# Altium schematic sheet 60_User_Interface.SchDoc: Interfaz de usuario
size A4; DrawnBy: Mateo Cárdenas; Revision: Rev A; SheetNumber: 7; SheetTotal: 7
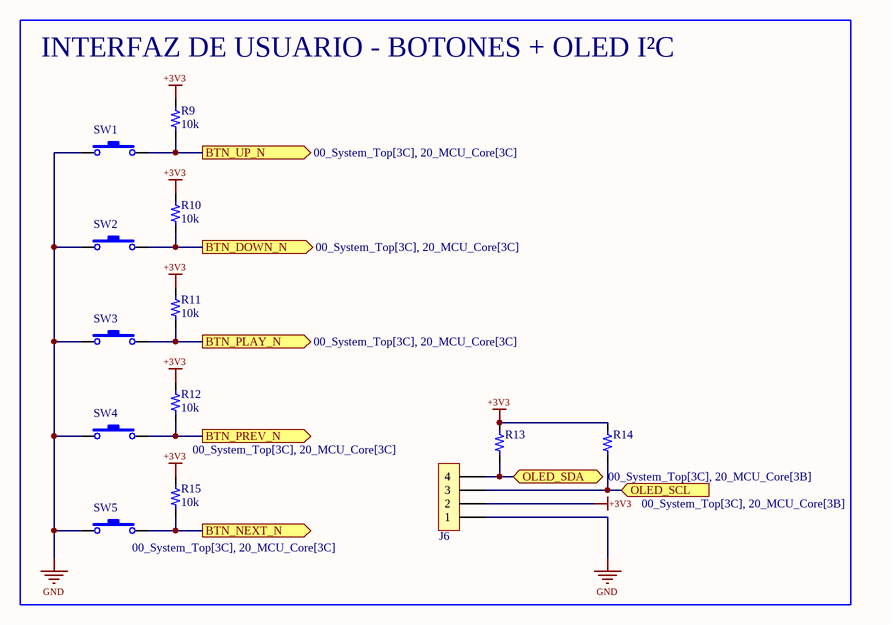
[diagram p0: 60_User_Interface.SchDoc]

## Parts
J6  4x1  [H_4x1_TH_2.54mm]  (value not drawn)  (no BOM)
R9  value 10k  [0603_res]  (hidden comment: 10k 1/10W)
R10  value 10k  [0603_res]  (hidden comment: 10k 1/10W)
R11  value 10k  [0603_res]  (hidden comment: 10k 1/10W)
R12  value 10k  [0603_res]  (hidden comment: 10k 1/10W)
R13  4k7 1/10W  [0603_res]  (value not drawn)
R14  4k7 1/10W  [0603_res]  (value not drawn)
R15  value 10k  [0603_res]  (hidden comment: 10k 1/10W)
SW1  Sw  [Sw_PUSH_4.5x4.5x5mm]  (value not drawn)
SW2  Sw  [Sw_PUSH_4.5x4.5x5mm]  (value not drawn)
SW3  Sw  [Sw_PUSH_4.5x4.5x5mm]  (value not drawn)
SW4  Sw  [Sw_PUSH_4.5x4.5x5mm]  (value not drawn)
SW5  Sw  [Sw_PUSH_4.5x4.5x5mm]  (value not drawn)

## Blocks framed on the sheet
INTERFAZ DE USUARIO - BOTONES + OLED I²C: J6 R9-R15 SW1-SW5

## Ports
BTN_DOWN_N (out, see 00_System_Top[3C], 20_MCU_Core[3C]), BTN_NEXT_N (out, see 00_System_Top[3C], 20_MCU_Core[3C]), BTN_PLAY_N (out, see 00_System_Top[3C], 20_MCU_Core[3C]), BTN_PREV_N (out, see 00_System_Top[3C], 20_MCU_Core[3C]), BTN_UP_N (out, see 00_System_Top[3C], 20_MCU_Core[3C]), OLED_SCL (in, see 00_System_Top[3C], 20_MCU_Core[3B]), OLED_SDA (bidir, see 00_System_Top[3C], 20_MCU_Core[3B])

## Nets
+3V3: J6.2 R9.1 R10.2 R11.2 R12.1 R13.2 R14.2 R15.1
GND: J6.1 SW1.1 SW2.1 SW3.1 SW4.1 SW5.1
BTN_DOWN_N: R10.1 SW2.2 ; port BTN_DOWN_N
BTN_NEXT_N: R15.2 SW5.2 ; port BTN_NEXT_N
BTN_PLAY_N: R11.1 SW3.2 ; port BTN_PLAY_N
BTN_PREV_N: R12.2 SW4.2 ; port BTN_PREV_N
BTN_UP_N: R9.2 SW1.2 ; port BTN_UP_N
OLED_SCL: J6.3 R14.1 ; port OLED_SCL
OLED_SDA: J6.4 R13.1 ; port OLED_SDA

## Library data of the parts
J6 = H_Male_4x1_TH_100mil: ComponentLink1Description: LCSC
R9-R12 R15 = Res_10k_0603_1/10W: RES SMD 10k OHM 5% 1/10W 0603; Manufacturer: FOJAN; Manufacturer Part Number: FRC0603J103TS; ComponentLink1URL: https://www.lcsc.com/product-detail/Chip-Resistor-Surface-Mount_FOJAN-FRC0603J103TS_C2930027.html; Supplier 1: LCSC; Supplier Part Number 1: C2930027; ComponentLink1Description: LCSC
R13 R14 = Res_4k7_0603_1/10W: 100mW Thick Film Resistor 75V ±1% 4.7kΩ 0603 Chip Resistor - Surface Mount ROHS; Manufacturer: VO; Manufacturer Part Number: SCR0603F4K7; ComponentLink1URL: https://lcsc.com/product-detail/Chip-Resistor-Surface-Mount_VO-SCR0603F4K7_C3016318.html; Supplier 1: LCSC; Supplier Part Number 1: C3016318; ComponentLink1Description: LCSC; Value: 4k7
SW1-SW5 = Sw_PUSH_4.5x4.5x5.0xmm: SWITCH TACTILE SPST-NO 0.05A 12V; Manufacturer: BZCN; Manufacturer Part Number: TSC015A05026A; Supplier 1: LCSC; Supplier Part Number 1: C2888509; Last modified by: N-A.Potosi; Last modified date: 20190222; ComponentLink1Description: LCSC; ComponentLink1URL: https://www.lcsc.com/product-detail/Tactile-Switches_BZCN-TSC015A05026A_C2888509.html